# Altium schematic sheet SCH DSI to DSI Adapter Rev-0.00.SchDoc
size A3; SheetNumber: 1; SheetTotal: 1
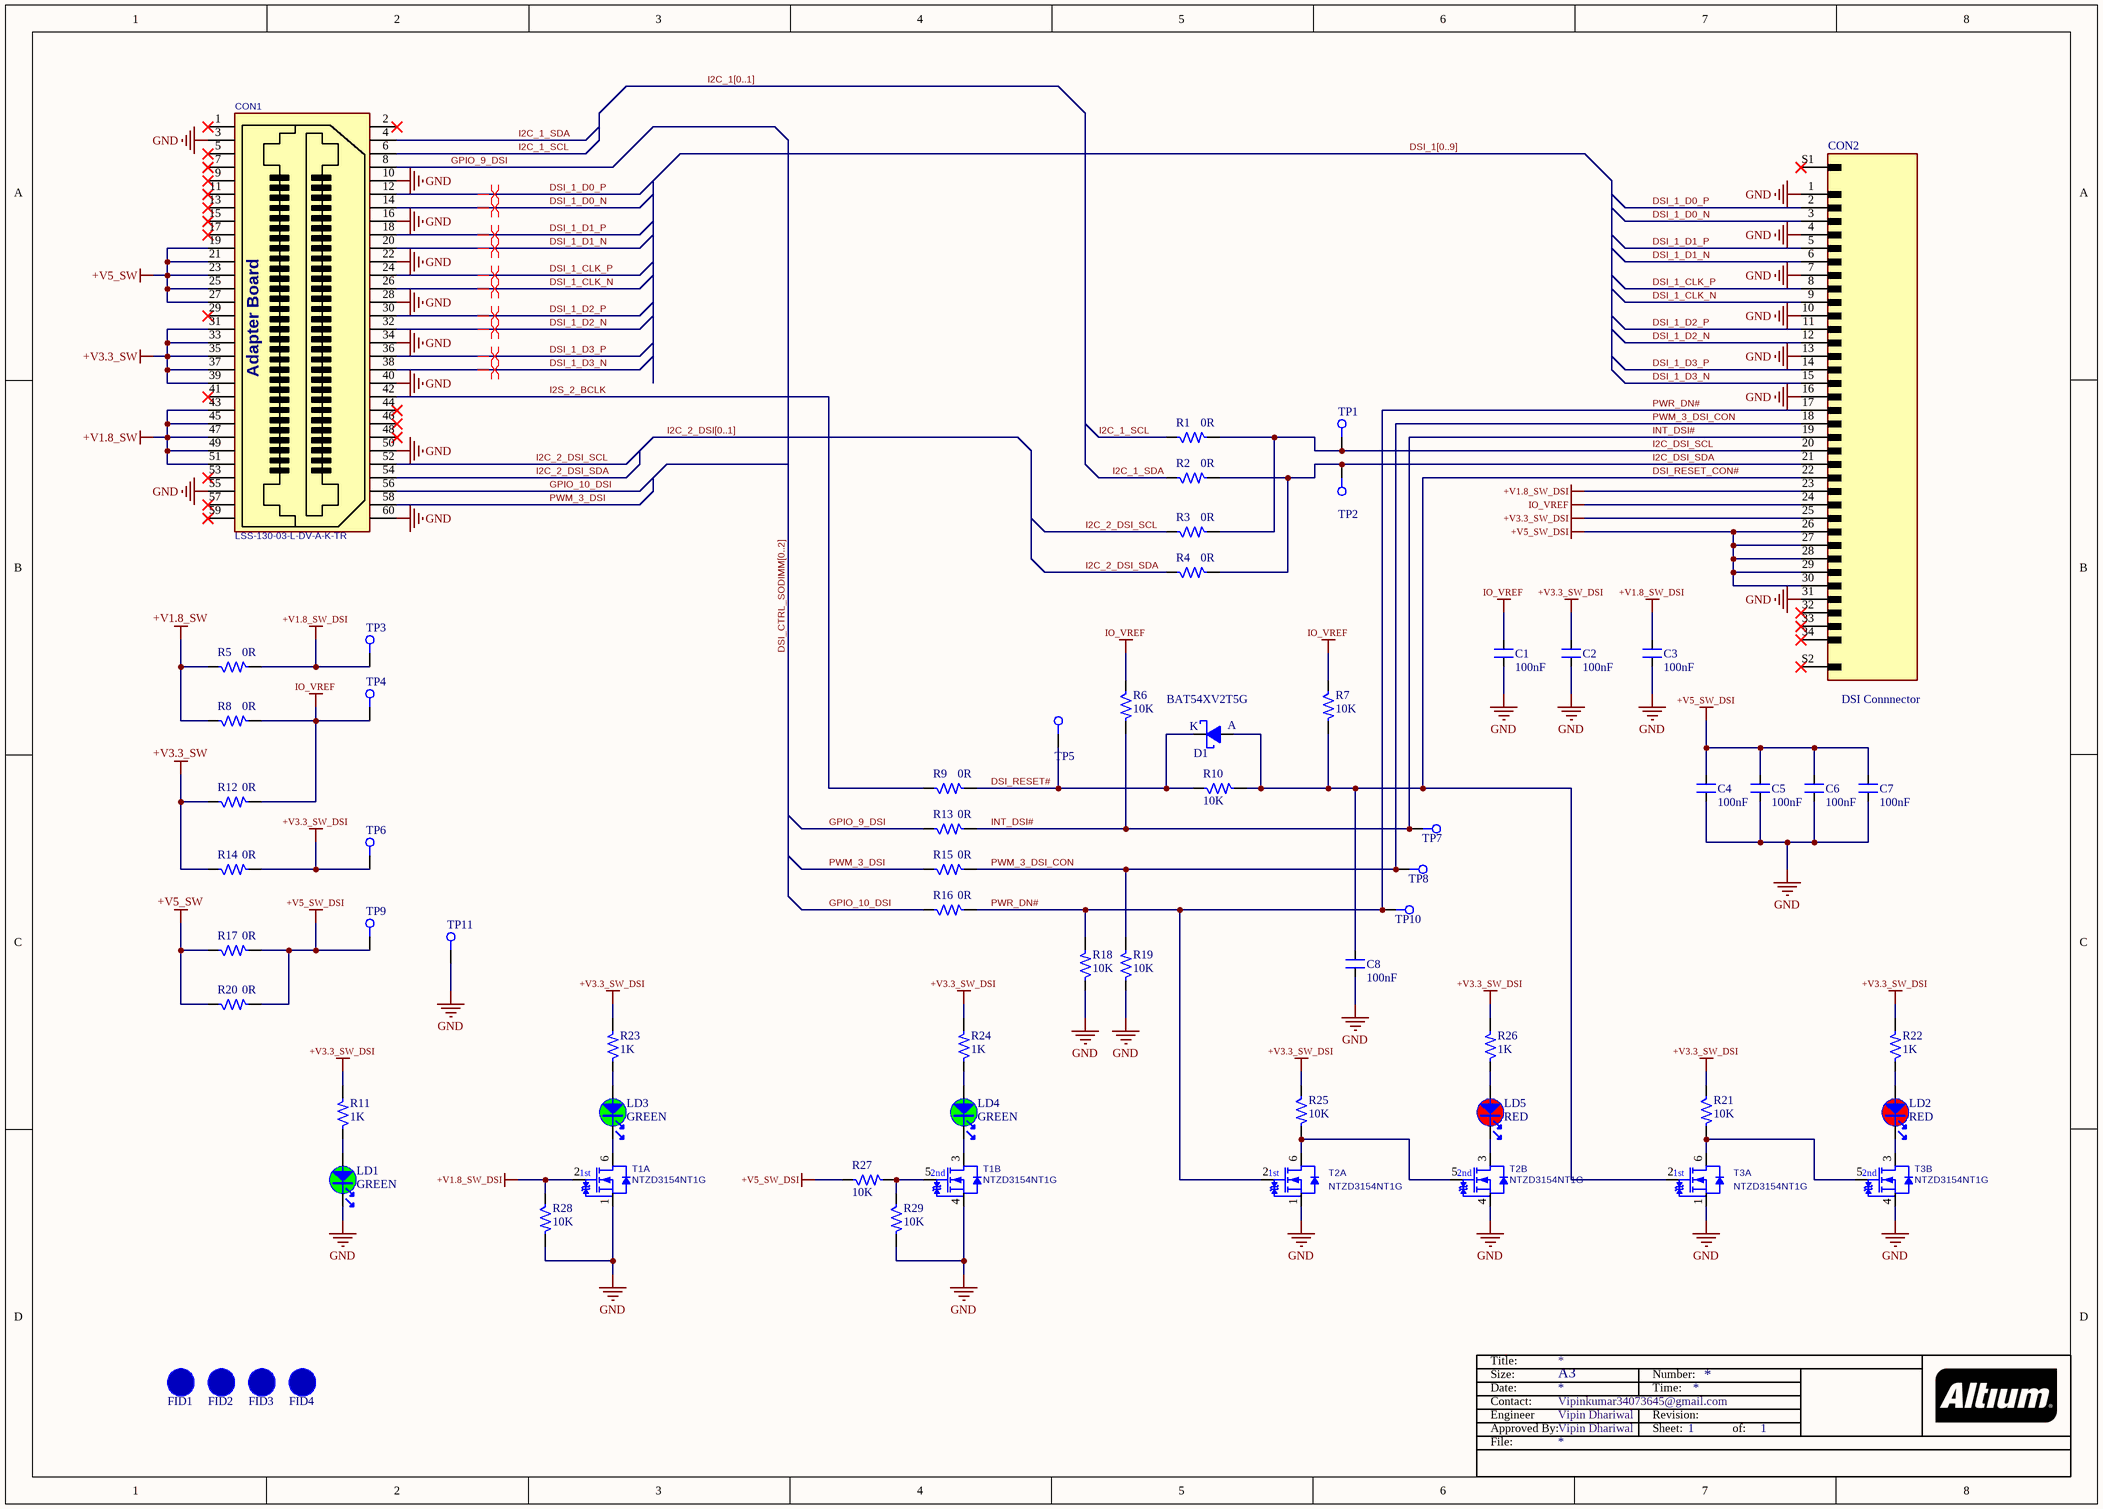
[diagram p0: SCH DSI to DSI Adapter Rev-0.00.SchDoc]

## Parts
C1  100nF  [CAP_0402]
C2  100nF  [CAP_0402]
C3  100nF  [CAP_0402]
C4  100nF  [CAP_0402]
C5  100nF  [CAP_0402]
C6  100nF  [CAP_0402]
C7  100nF  [CAP_0402]
C8  100nF  [CAP_0402]
CON1  LSS-130-03-L-DV-A-K-TR  [CON-SAMTEC-LSS-130-03-L-DV-A-ADAPTER]
CON2  DSI Connnector  [CON-PLG-FPC_34X1-19-RA-BC-SMD]
D1  BAT54XV2T5G  [DIO_SOD523]
FID1  FID_1MM_SMALL  [FID_40X52D]  (value not drawn)  (no BOM)
FID2  FID_1MM_SMALL  [FID_40X52D]  (value not drawn)  (no BOM)
FID3  FID_1MM_SMALL  [FID_40X52D]  (value not drawn)  (no BOM)
FID4  FID_1MM_SMALL  [FID_40X52D]  (value not drawn)  (no BOM)
LD1  value GREEN  [LED_0603_GREEN]  (hidden comment: LED_green)
LD2  value RED  [LED_0603_RED]  (hidden comment: LED_red)
LD3  value GREEN  [LED_0603_GREEN]  (hidden comment: LED_green)
LD4  value GREEN  [LED_0603_GREEN]  (hidden comment: LED_green)
LD5  value RED  [LED_0603_RED]  (hidden comment: LED_red)
R1  0R  [RES_0603]
R2  0R  [RES_0603]
R3  0R  [RES_0603]
R4  0R  [RES_0603]
R5  0R  [RES_0603]
R6  10K  [RES_0402]
R7  10K  [RES_0402]
R8  0R  [RES_0603]
R9  0R  [RES_0603]
R10  10K  [RES_0402]
R11  1K  [RES_0402]
R12  0R  [RES_0603]
R13  0R  [RES_0603]
R14  0R  [RES_0603]
R15  0R  [RES_0603]
R16  0R  [RES_0603]
R17  0R  [RES_0603]
R18  10K  [RES_0402]
R19  10K  [RES_0402]
R20  0R  [RES_0603]
R21  10K  [RES_0402]
R22  1K  [RES_0402]
R23  1K  [RES_0402]
R24  1K  [RES_0402]
R25  10K  [RES_0402]
R26  1K  [RES_0402]
R27  10K  [RES_0402]
R28  10K  [RES_0402]
R29  10K  [RES_0402]
T1  Manufacturer Part No.: NTZD3154NT1G  [SOTFL50P160X60-6N]  (hidden comment: T-ONSemi-NTZD3154NT1G)  (parts A,B of 2)
T2  Manufacturer Part No.: NTZD3154NT1G  [SOTFL50P160X60-6N]  (hidden comment: T-ONSemi-NTZD3154NT1G)  (parts A,B of 2)
T3  Manufacturer Part No.: NTZD3154NT1G  [SOTFL50P160X60-6N]  (hidden comment: T-ONSemi-NTZD3154NT1G)  (parts A,B of 2)
TP1  TP_25MILC  [T_TP-SMD]  (value not drawn)  (no BOM)
TP2  TP_25MILC  [T_TP-SMD]  (value not drawn)  (no BOM)
TP3  TP_25MILC  [T_TP-SMD]  (value not drawn)  (no BOM)
TP4  TP_25MILC  [T_TP-SMD]  (value not drawn)  (no BOM)
TP5  TP_25MILC  [T_TP-SMD]  (value not drawn)  (no BOM)
TP6  TP_25MILC  [T_TP-SMD]  (value not drawn)  (no BOM)
TP7  TP_25MILC  [T_TP-SMD]  (value not drawn)  (no BOM)
TP8  TP_25MILC  [T_TP-SMD]  (value not drawn)  (no BOM)
TP9  TP_25MILC  [T_TP-SMD]  (value not drawn)  (no BOM)
TP10  TP_25MILC  [T_TP-SMD]  (value not drawn)  (no BOM)
TP11  TP_25MILC  [T_TP-SMD]  (value not drawn)  (no BOM)

## Nets
+V1.8_SW: CON1.43 CON1.45 CON1.47 CON1.49 CON1.51 R5.1 R8.1
+V1.8_SW_DSI: C3.2 CON2.23 R5.2 R28.1 T1.2(G1) TP3.1
+V3.3_SW: CON1.31 CON1.33 CON1.35 CON1.37 CON1.39 R12.1 R14.1
+V3.3_SW_DSI: C2.2 CON2.25 R11.2 R14.2 R21.1 R22.2 R23.2 R24.2 R25.1 R26.2 TP6.1
+V5_SW: CON1.19 CON1.21 CON1.23 CON1.25 CON1.27 R17.1 R20.1
+V5_SW_DSI: C4.2 C5.2 C6.2 C7.2 CON2.26 CON2.27 CON2.28 CON2.29 CON2.30 R17.2 R20.2 R27.1 TP9.1
GND: C1.1 C2.1 C3.1 C4.1 C5.1 C6.1 C7.1 C8.1 CON1.3 CON1.10 CON1.16 CON1.22 CON1.28 CON1.34 CON1.40 CON1.50 CON1.55 CON1.60 CON2.1 CON2.4 CON2.7 CON2.10 CON2.13 CON2.16 CON2.31 LD1.2 R18.1 R19.1 R28.2 R29.2 T1.1(S1) T1.4(S2) T2.1(S1) T2.4(S2) T3.1(S1) T3.4(S2) TP11.1
IO_VREF: C1.2 CON2.24 R6.1 R7.1 R8.2 R12.2 TP4.1
DSI_1_CLK_N: CON1.26 CON2.9
DSI_1_CLK_P: CON1.24 CON2.8
DSI_1_D0_N: CON1.14 CON2.3
DSI_1_D0_P: CON1.12 CON2.2
DSI_1_D1_N: CON1.20 CON2.6
DSI_1_D1_P: CON1.18 CON2.5
DSI_1_D2_N: CON1.32 CON2.12
DSI_1_D2_P: CON1.30 CON2.11
DSI_1_D3_N: CON1.38 CON2.15
DSI_1_D3_P: CON1.36 CON2.14
DSI_RESET#: D1.K R9.2 R10.1 TP5.1
DSI_RESET_CON#: C8.2 CON2.22 D1.A R7.2 R10.2 T3.2(G1)
GPIO_9_DSI: CON1.8 R13.1
GPIO_10_DSI: CON1.56 R16.1
I2C_1_SCL: CON1.6 R1.1
I2C_1_SDA: CON1.4 R2.1
I2C_2_DSI_SCL: CON1.52 R3.1
I2C_2_DSI_SDA: CON1.54 R4.1
I2C_DSI_SCL: CON2.20 R1.2 R3.2 TP1.1
I2C_DSI_SDA: CON2.21 R2.2 R4.2 TP2.1
I2S_2_BCLK: CON1.42 R9.1
INT_DSI#: CON2.19 R6.2 R13.2 TP7.1
PWM_3_DSI: CON1.58 R15.1
PWM_3_DSI_CON: CON2.18 R15.2 R19.2 TP8.1
PWR_DN#: CON2.17 R16.2 R18.2 T2.2(G1) TP10.1
NetLD1_1: LD1.1 R11.1
NetLD2_1: LD2.1 R22.1
NetLD2_2: LD2.2 T3.3(D2)
NetLD3_1: LD3.1 R23.1
NetLD3_2: LD3.2 T1.6(D1)
NetLD4_1: LD4.1 R24.1
NetLD4_2: LD4.2 T1.3(D2)
NetLD5_1: LD5.1 R26.1
NetLD5_2: LD5.2 T2.3(D2)
NetR21_2: R21.2 T3.5(G2) T3.6(D1)
NetR25_2: R25.2 T2.5(G2) T2.6(D1)
NetR27_2: R27.2 R29.1 T1.5(G2)

Not connected (* = marked no-connect by the designer): CON1 1* 2* 5* 7* 9* 11* 13* 15* 17* 29* 41* 44* 46* 48* 53* 57* 59*; CON2 32* 33* 34* S1* S2*

## Buses and harness runs
bus DSI_1[0..9]
bus DSI_CTRL_SODIMM[0..2]
bus I2C_1[0..1]
bus I2C_2_DSI[0..1]

## Layout directives
differential pair; differential pair class DSI; rule Differential Pairs Routing [Pref Gap = 0.2mm    Min Gap  = 0.2mm    Max Gap  = 0.2mmPref Width = 0.15mm    Min Width  = 0.15mm    Max Width  = 0.15mm]; rule Routing Via Style [Pref Size = 0.6mm    Pref Hole Size = 0.3mm]: DSI_1_CLK_N, DSI_1_CLK_P, DSI_1_D0_N, DSI_1_D0_P, DSI_1_D1_N, DSI_1_D1_P, DSI_1_D2_N, DSI_1_D2_P, DSI_1_D3_N, DSI_1_D3_P

## Notes on the sheet
- Title:
- Size:
- Date:
- A3
- Number:
- Time:
- File:
- Contact:
- Engineer
- Approved By:
- Vipinkumar34073645@gmail.com
- Vipin Dhariwal
- Revision:
- Sheet:
- of:
- (in symbol CON-Samtec-LSS-130-03-L-DV-A-K-TR-ADAPTER) Adapter Board
- (in symbol T-ONSemi-NTZD3154NT1G, part A) 1st
- (in symbol T-ONSemi-NTZD3154NT1G, part B) 2nd

## Library data of the parts
C1-C8 = CAP_100nF-25V-10%-0402: 0.1µF ±10% 25V Ceramic Capacitor X7R 0402 (1005 Metric); Manufacturer: Walsin Technology Corporation; Manufacturer Part Number: 0402B104K250CT; Case/Package: 0402; Supplier-1: Digikey
CON1 = CON-Samtec-LSS-130-03-L-DV-A-K-TR-ADAPTER: 60 Position Connector, Self Mating, Non-Gendered, Surface Mount; Manufacturer Name: Samtec; Pitch: 0.635mm; No. of ways: 60; Manufacturer Part No.: LSS-130-03-L-DV-A-K-TR
CON2 = CON-PLG-FPC_34X1-19-RA-BC-SMD: 34 Position FFC, FPC Connector Contacts, 0.020" (0.50mm) Surface Mount, Right Angle FFC & FPC Connectors 0.5 FPC EASYON BTM CONT RA 30CKT ZIF
D1 = DIO-BAT54XV2T5G: Schottky Barrier Rectifier; Manufacturer: Diodes Incorporated; Manufacturer Part Number: BZT52C3V3T-7; Case/Package: SOD523; Supplier-1: Digikey
FID1-FID4 = FID_1MM_SMALL: Fiducial 40mil Diameter, 52mil Mask; Supplier: Digikey
LD1 LD3 LD4 = LED_green: LED, Green, 0603; Internal_Part_Number: MCD-00050; Part_Type: Display; Manufacturer_Part_Number: 19-213SYGC/S530-E2/TR8; Manufacturer: EVERLIGHT; ECCN_US: EAR99; ECCN_EU: NEC; Provided_By: SUBCO; Status: Released; ComponentLink1Description: Datasheet; ComponentLink1URL: http://tunmcdsvn.tun.st.com/Component_Datasheet_Library/Trunk/Display/Everlight_SMD-LED-GREEN_19-213SYGC-S530-XX-TR8-v3.doc; Package: LED 0603
LD2 LD5 = LED_red: LED, Red, 0603; Internal_Part_Number: MCD-00049; Manufacturer_Part_Number: 19-213-R6C-AP1Q2B/3T; Manufacturer: EVERLIGHT; Part_Type: Display; ECCN_US: EAR99; ECCN_EU: NEC; Provided_By: SUBCO; ComponentLink1Description: Datasheet; Status: Released; ComponentLink1URL: http://tunmcdsvn.tun.st.com/Component_Datasheet_Library/Trunk/Display/Everlight_SMD-LED-RED_19-213-R6C-AP1Q2B-3T-V3.doc; Package: LED 0603
R1-R5 R8 R9 R12-R17 R20 = RES_0R-0.1W-1%-0603: 0 Ohms Jumper 0.1W, 1/10W Chip Resistor 0603 (1608 Metric) Thick Film; Manufacturer: Yageo; Manufacturer Part Number: RC0603JR-070RL; Case/Package: 0603; Supplier-1: Digikey
R6 R7 R10 R18 R19 R21 R25 R27-R29 = RES_10K-0.1W-1%-0402: 10 kOhms ±1% 0.1W, 1/10W Chip Resistor 0402 (1005 Metric) Anti-Sulfur Thin Film; Manufacturer: Vishay Beyschlag/Draloric/BC Components; Manufacturer Part Number: MCS04020C1002FE000; Case/Package: 0402; Supplier-1: Digikey
R11 R22-R24 R26 = RES_1K-0.1W-1%-0402: 1 kOhms ±1% 0.1W, 1/10W Chip Resistor 0402 (1005 Metric) Anti-Sulfur Thin Film; Manufacturer: Vishay Beyschlag/Draloric/BC Components; Manufacturer Part Number: MCS04020C1001FE000; Case/Package: 0402; Supplier-1: Digikey
T1-T3 = T-ONSemi-NTZD3154NT1G: Dual N-Channel 20V (D-S)  MOSFET; Manufacturer Name: ONSemi
TP1-TP11 = TP_25MILC: Test Point 25mil